# Altium schematic sheet Debug.SchDoc
size A
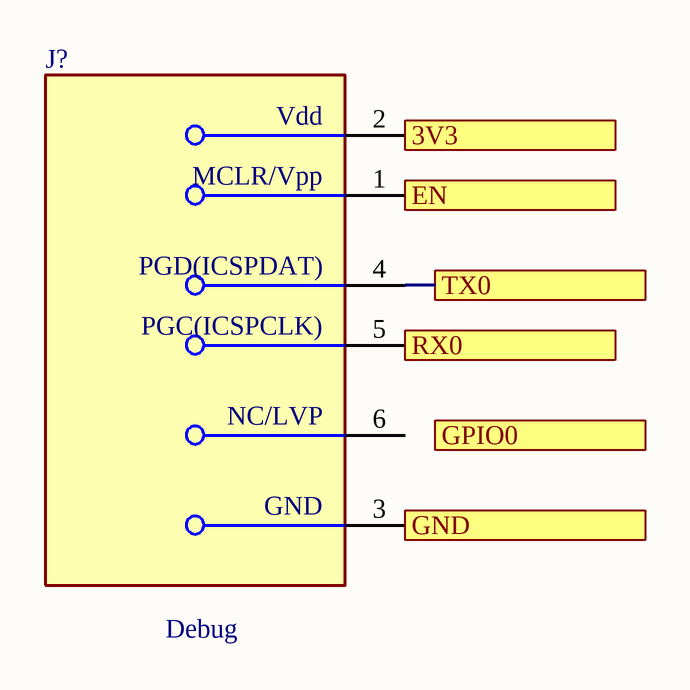
[diagram p0: Debug.SchDoc]

## Parts
J?  Debug  [FP-TC2030-MCP-NL-MFG]

## Ports
3V3, EN, GND, GPIO0, RX0, TX0

## Nets
3V3: J?.2(Vdd) ; port 3V3
EN: J?.1(MCLR/Vpp) ; port EN
GND: J?.3(GND) ; port GND
RX0: J?.5(PGC(ICSPCLK)) ; port RX0
TX0: J?.4(PGD(ICSPDAT)) ; port TX0

Not connected (* = marked no-connect by the designer): J? 6(NC/LVP)

## Library data of the parts
J? = CMP-205963-000002-1: CABLE TAG-CONNECT IN-CIRCUIT; RoHS Compliant: Yes; Series: -; Reach SVHC Compliant: Yes; Package Quantity: 1; Lead Free: Lead Free